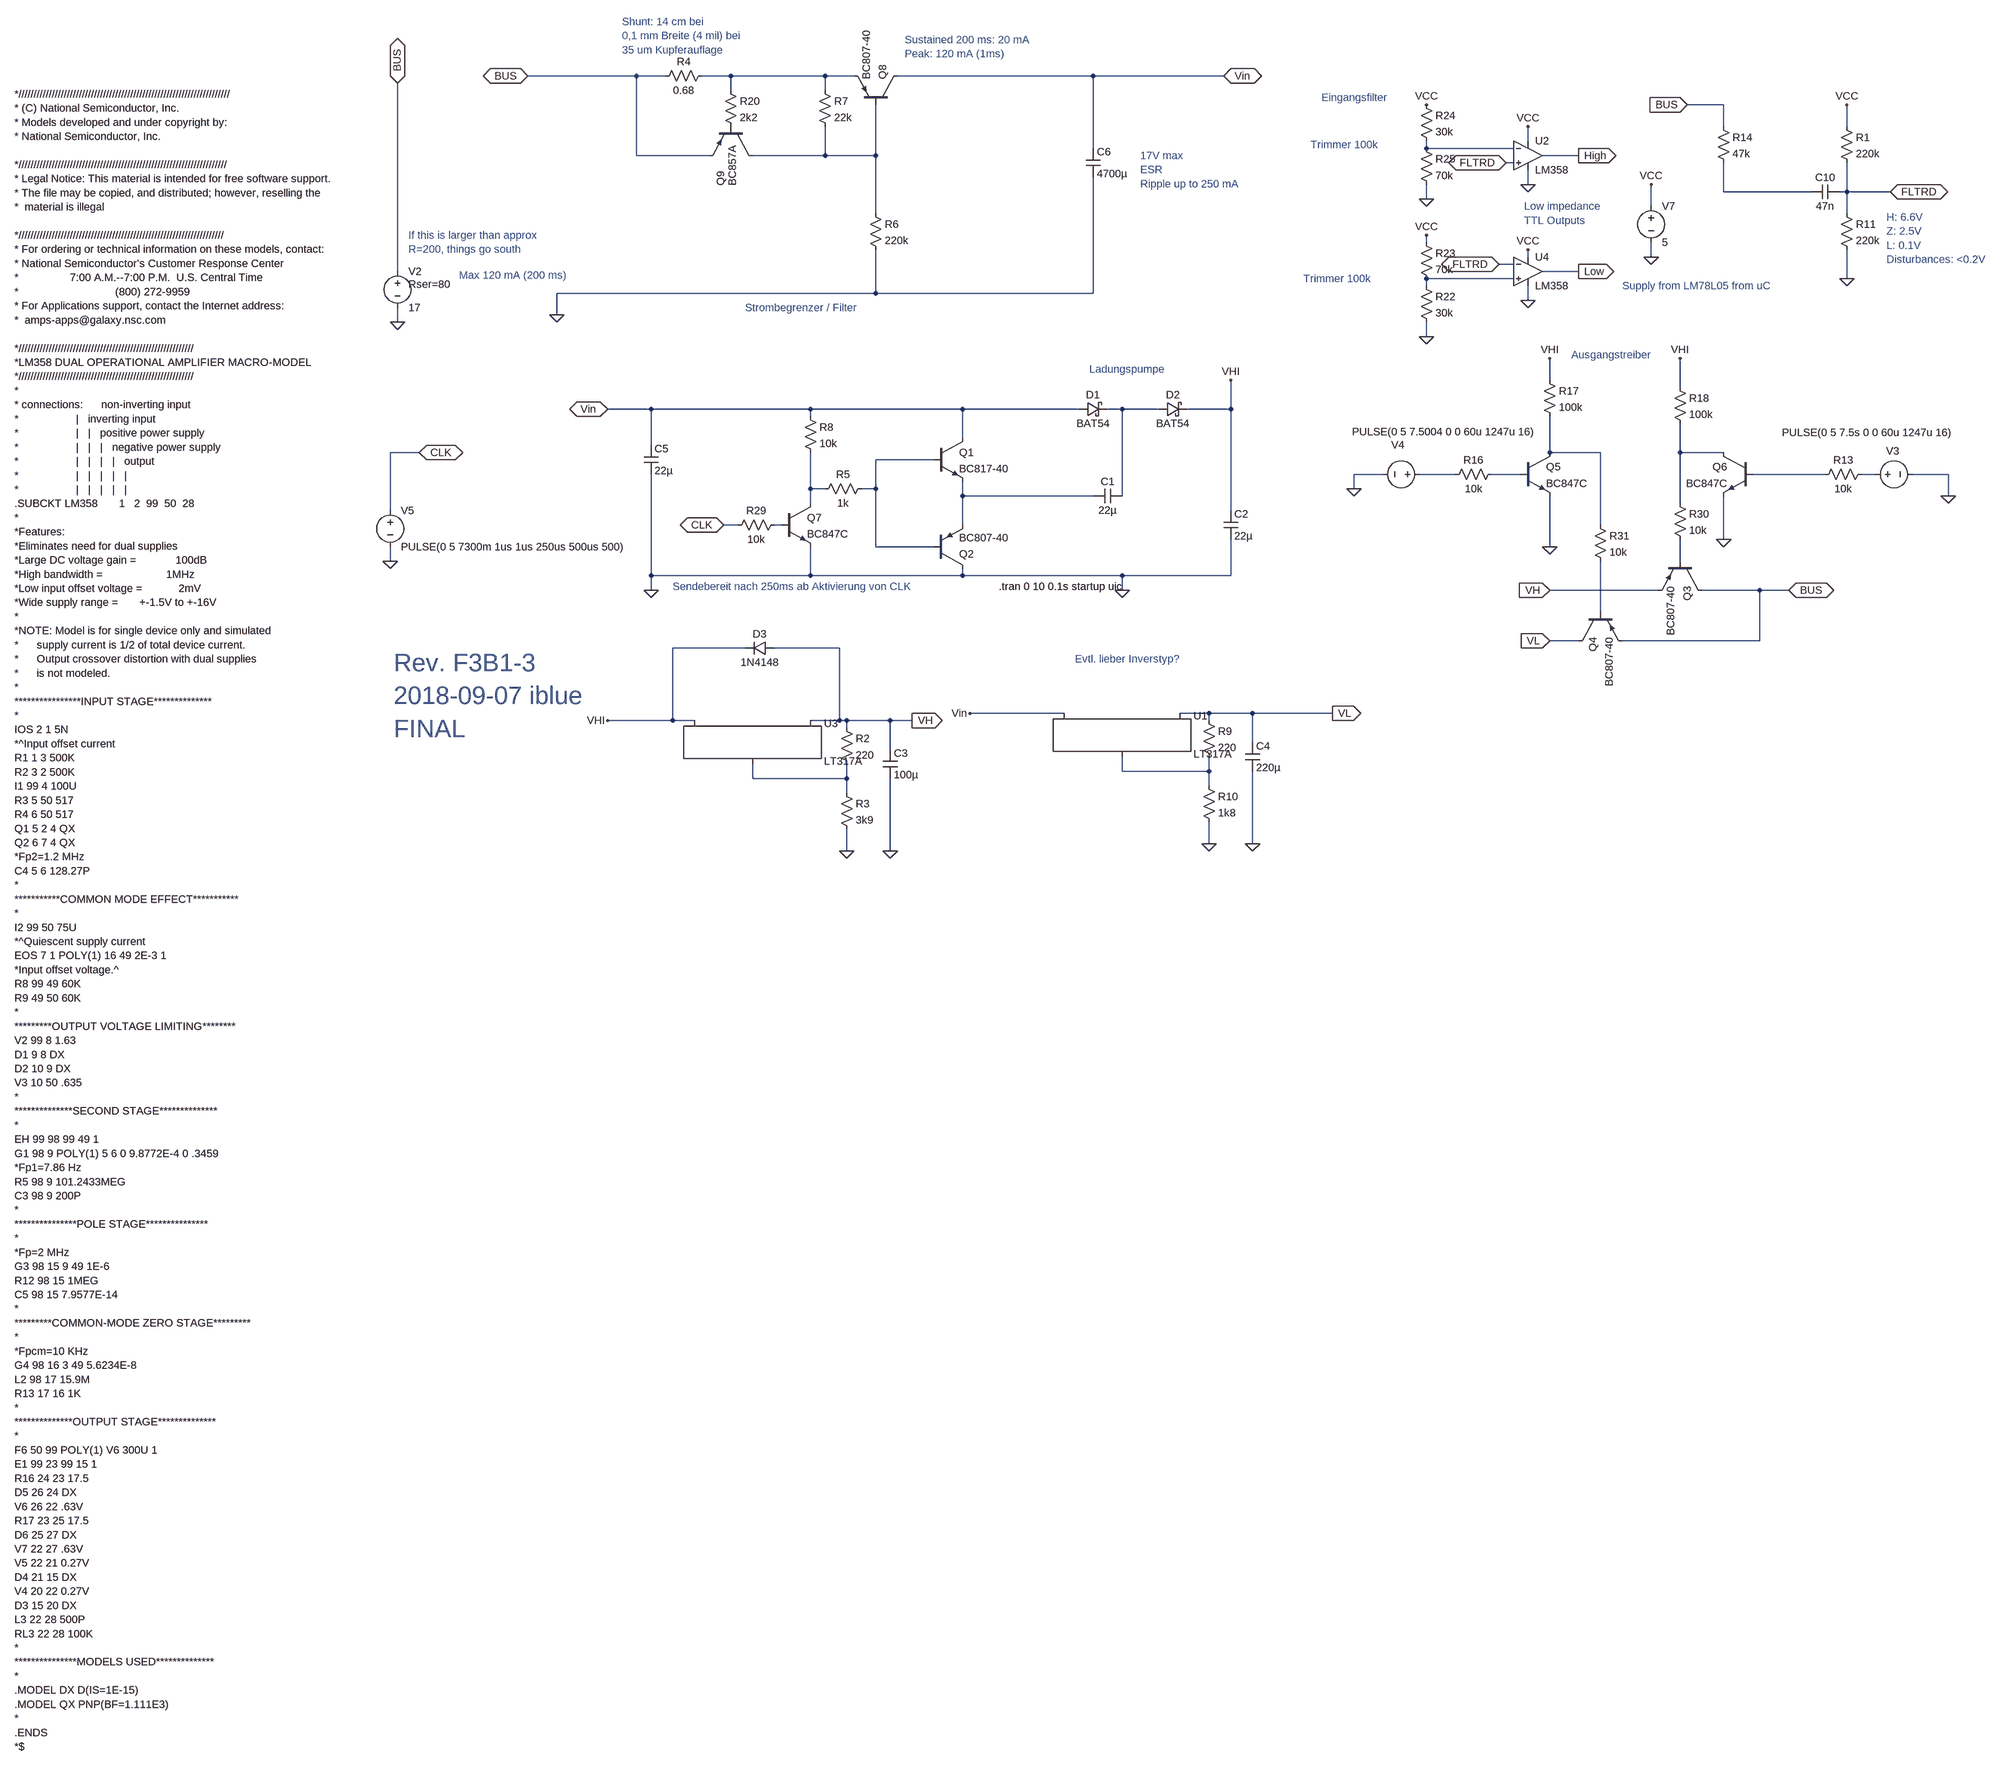
[diagram p0: schematic Final-F3B1-3.asc]
Final-F3B1-3.asc, the LTspice schematic file:
Version 4
SHEET 1 2516 2612
WIRE -1648 -800 -1888 -800
WIRE -1584 -800 -1648 -800
WIRE -1440 -800 -1504 -800
WIRE -1232 -800 -1440 -800
WIRE -1168 -800 -1232 -800
WIRE -640 -800 -1072 -800
WIRE -352 -800 -640 -800
WIRE -1440 -768 -1440 -800
WIRE -1232 -768 -1232 -800
WIRE 752 -736 672 -736
WIRE 752 -688 752 -736
WIRE 1024 -688 1024 -736
WIRE 320 -656 320 -688
WIRE -640 -640 -640 -800
WIRE 96 -640 96 -656
WIRE 288 -640 96 -640
WIRE -1648 -624 -1648 -800
WIRE -1488 -624 -1648 -624
WIRE -1232 -624 -1232 -688
WIRE -1232 -624 -1392 -624
WIRE -1120 -624 -1120 -736
WIRE -1120 -624 -1232 -624
WIRE 432 -624 352 -624
WIRE 288 -608 272 -608
WIRE 320 -560 320 -592
WIRE 752 -544 752 -608
WIRE 944 -544 752 -544
WIRE 1024 -544 1024 -608
WIRE 1024 -544 1008 -544
WIRE 1120 -544 1024 -544
WIRE 96 -528 96 -560
WIRE 592 -512 592 -560
WIRE -1120 -496 -1120 -624
WIRE 1024 -496 1024 -544
WIRE 96 -432 96 -448
WIRE 320 -400 320 -416
WIRE 592 -400 592 -432
WIRE 288 -384 256 -384
WIRE -2176 -368 -2176 -784
WIRE 432 -368 352 -368
WIRE 288 -352 96 -352
WIRE 1024 -352 1024 -416
WIRE 96 -336 96 -352
WIRE -1120 -320 -1120 -416
WIRE -1120 -320 -1824 -320
WIRE -640 -320 -640 -576
WIRE -640 -320 -1120 -320
WIRE 320 -304 320 -336
WIRE -1824 -272 -1824 -320
WIRE -2176 -256 -2176 -288
WIRE 96 -224 96 -256
WIRE 368 -128 368 -176
WIRE 656 -112 656 -176
WIRE -1616 -64 -1712 -64
WIRE -1264 -64 -1616 -64
WIRE -928 -64 -1264 -64
WIRE -672 -64 -928 -64
WIRE -576 -64 -608 -64
WIRE -496 -64 -576 -64
WIRE -336 -64 -336 -128
WIRE -336 -64 -432 -64
WIRE -1264 -48 -1264 -64
WIRE -928 0 -928 -64
WIRE -1616 16 -1616 -64
WIRE -2128 32 -2192 32
WIRE 368 32 368 -48
WIRE 480 32 368 32
WIRE 656 32 656 -32
WIRE 752 32 656 32
WIRE -992 48 -1120 48
WIRE 0 80 -64 80
WIRE 160 80 80 80
WIRE 304 80 240 80
WIRE 976 80 816 80
WIRE 1088 80 1056 80
WIRE 1248 80 1168 80
WIRE -1264 112 -1264 32
WIRE -1232 112 -1264 112
WIRE -1120 112 -1120 48
WIRE -1120 112 -1152 112
WIRE -64 112 -64 80
WIRE -928 128 -928 96
WIRE -640 128 -928 128
WIRE -576 128 -576 -64
WIRE 1248 128 1248 80
WIRE -1264 144 -1264 112
WIRE 656 144 656 32
WIRE -2192 160 -2192 32
WIRE -336 160 -336 -64
WIRE -1424 192 -1456 192
WIRE -1328 192 -1344 192
WIRE -928 192 -928 128
WIRE 480 192 480 32
WIRE 752 224 752 128
WIRE -1120 240 -1120 112
WIRE -992 240 -1120 240
WIRE 368 240 368 128
WIRE -2192 272 -2192 240
WIRE 656 272 656 224
WIRE -1616 304 -1616 80
WIRE -1264 304 -1264 240
WIRE -1264 304 -1616 304
WIRE -928 304 -928 288
WIRE -928 304 -1264 304
WIRE -576 304 -928 304
WIRE -336 304 -336 224
WIRE -336 304 -576 304
WIRE -1616 336 -1616 304
WIRE -576 336 -576 304
WIRE 608 336 368 336
WIRE 832 336 704 336
WIRE 896 336 832 336
WIRE 480 384 480 272
WIRE 432 448 368 448
WIRE 832 448 832 336
WIRE 832 448 528 448
WIRE -1408 464 -1568 464
WIRE -1200 464 -1344 464
WIRE -704 608 -912 608
WIRE -384 608 -448 608
WIRE -288 608 -384 608
WIRE -112 608 -288 608
WIRE -1568 624 -1568 464
WIRE -1568 624 -1712 624
WIRE -1520 624 -1568 624
WIRE -1200 624 -1200 464
WIRE -1200 624 -1264 624
WIRE -1184 624 -1200 624
WIRE -1088 624 -1184 624
WIRE -1040 624 -1088 624
WIRE -384 624 -384 608
WIRE -1184 640 -1184 624
WIRE -288 672 -288 608
WIRE -1088 688 -1088 624
WIRE -576 736 -576 704
WIRE -384 736 -384 704
WIRE -384 736 -576 736
WIRE -1392 752 -1392 720
WIRE -1184 752 -1184 720
WIRE -1184 752 -1392 752
WIRE -384 768 -384 736
WIRE -1184 784 -1184 752
WIRE -384 896 -384 848
WIRE -288 896 -288 736
WIRE -1184 912 -1184 864
WIRE -1088 912 -1088 752
FLAG -576 336 0
FLAG -1456 192 CLK
IOPIN -1456 192 BiDir
FLAG -336 -128 VHI
FLAG -1040 624 VH
IOPIN -1040 624 Out
FLAG -1712 624 VHI
FLAG -1088 912 0
FLAG -112 608 VL
IOPIN -112 608 Out
FLAG 1248 128 0
FLAG 368 448 VL
IOPIN 368 448 In
FLAG 368 336 VH
IOPIN 368 336 In
FLAG 368 -176 VHI
FLAG -64 112 0
FLAG 368 240 0
FLAG 656 -176 VHI
FLAG 752 224 0
FLAG -2192 272 0
FLAG -2128 32 CLK
IOPIN -2128 32 BiDir
FLAG -2176 -256 0
FLAG -2176 -784 BUS
IOPIN -2176 -784 BiDir
FLAG -1824 -272 0
FLAG -352 -800 Vin
IOPIN -352 -800 BiDir
FLAG -1712 -64 Vin
IOPIN -1712 -64 BiDir
FLAG -1616 336 0
FLAG -1888 -800 BUS
IOPIN -1888 -800 BiDir
FLAG 896 336 BUS
IOPIN 896 336 BiDir
FLAG 672 -736 BUS
IOPIN 672 -736 In
FLAG 432 -368 Low
IOPIN 432 -368 Out
FLAG 432 -624 High
IOPIN 432 -624 Out
FLAG 320 -560 0
FLAG 320 -304 0
FLAG 96 -528 0
FLAG 96 -224 0
FLAG 592 -400 0
FLAG 592 -560 VCC
FLAG 320 -688 VCC
FLAG 320 -416 VCC
FLAG 96 -736 VCC
FLAG 1120 -544 FLTRD
IOPIN 1120 -544 BiDir
FLAG 272 -608 FLTRD
IOPIN 272 -608 BiDir
FLAG 96 -448 VCC
FLAG 256 -384 FLTRD
IOPIN 256 -384 BiDir
FLAG -912 608 Vin
FLAG -1184 912 0
FLAG -288 896 0
FLAG -384 896 0
FLAG 1024 -352 0
FLAG 1024 -736 VCC
SYMBOL schottky -672 -48 R270
WINDOW 0 32 32 VTop 2
WINDOW 3 0 32 VBottom 2
SYMATTR InstName D1
SYMATTR Value BAT54
SYMATTR Description Diode
SYMATTR Type diode
SYMBOL schottky -496 -48 R270
WINDOW 0 32 32 VTop 2
WINDOW 3 0 32 VBottom 2
SYMATTR InstName D2
SYMATTR Value BAT54
SYMATTR Description Diode
SYMATTR Type diode
SYMBOL cap -576 112 R90
WINDOW 0 0 32 VBottom 2
WINDOW 3 32 32 VTop 2
SYMATTR InstName C1
SYMATTR Value 22µ
SYMBOL cap -352 160 R0
SYMATTR InstName C2
SYMATTR Value 22µ
SYMBOL voltage 1072 80 M90
WINDOW 0 -51 68 VLeft 2
WINDOW 3 -92 185 VLeft 2
WINDOW 123 0 0 Left 0
WINDOW 39 0 0 Left 0
SYMATTR InstName V3
SYMATTR Value PULSE(0 5 7.5s 0 0 60u 1247u 16)
SYMBOL res 1072 64 R90
WINDOW 0 0 56 VBottom 2
WINDOW 3 32 56 VTop 2
SYMATTR InstName R13
SYMATTR Value 10k
SYMBOL voltage 96 80 M270
WINDOW 0 65 78 VLeft 2
WINDOW 3 94 164 VLeft 2
WINDOW 123 0 0 Left 0
WINDOW 39 0 0 Left 0
SYMATTR InstName V4
SYMATTR Value PULSE(0 5 7.5004 0 0 60u 1247u 16)
SYMBOL npn 304 32 R0
SYMATTR InstName Q5
SYMATTR Value BC847C
SYMBOL res 256 64 R90
WINDOW 0 0 56 VBottom 2
WINDOW 3 32 56 VTop 2
SYMATTR InstName R16
SYMATTR Value 10k
SYMBOL res 352 -144 R0
SYMATTR InstName R17
SYMATTR Value 100k
SYMBOL npn 816 32 M0
SYMATTR InstName Q6
SYMATTR Value BC847C
SYMBOL res 640 -128 R0
SYMATTR InstName R18
SYMATTR Value 100k
SYMBOL npn -992 0 R0
SYMATTR InstName Q1
SYMATTR Value BC817-40
SYMBOL pnp -992 288 M180
SYMATTR InstName Q2
SYMATTR Value BC807-40
SYMBOL npn -1328 144 R0
SYMATTR InstName Q7
SYMATTR Value BC847C
SYMBOL res -1280 -64 R0
SYMATTR InstName R8
SYMATTR Value 10k
SYMBOL voltage -2192 144 R0
WINDOW 123 0 0 Left 0
WINDOW 39 0 0 Left 0
SYMATTR InstName V5
SYMATTR Value PULSE(0 5 7300m 1us 1us 250us 500us 500)
SYMBOL cap -1632 16 R0
SYMATTR InstName C5
SYMATTR Value 22µ
SYMBOL voltage -2176 -384 R0
WINDOW 123 0 0 Left 0
WINDOW 39 24 44 Left 2
SYMATTR SpiceLine Rser=80
SYMATTR InstName V2
SYMATTR Value 17
SYMBOL pnp -1072 -736 M270
SYMATTR InstName Q8
SYMATTR Value BC807-40
SYMBOL cap -656 -640 R0
SYMATTR InstName C6
SYMATTR Value 4700µ
SYMBOL pnp 704 272 R90
SYMATTR InstName Q3
SYMATTR Value BC807-40
SYMBOL pnp 432 384 M90
SYMATTR InstName Q4
SYMATTR Value BC807-40
SYMBOL voltage 592 -528 R0
WINDOW 123 0 0 Left 0
WINDOW 39 0 0 Left 0
SYMATTR InstName V7
SYMATTR Value 5
SYMBOL res 80 -352 R0
SYMATTR InstName R22
SYMATTR Value 30k
SYMBOL res 80 -448 R0
SYMATTR InstName R23
SYMATTR Value 70k
SYMBOL res 80 -752 R0
SYMATTR InstName R24
SYMATTR Value 30k
SYMBOL res 80 -656 R0
SYMATTR InstName R25
SYMATTR Value 70k
SYMBOL Opamps\\opamp2 320 -688 R0
SYMATTR InstName U2
SYMATTR Value LM358
SYMBOL Opamps\\opamp2 320 -432 R0
SYMATTR InstName U4
SYMATTR Value LM358
SYMBOL cap 1008 -560 R90
WINDOW 0 0 32 VBottom 2
WINDOW 3 32 32 VTop 2
SYMATTR InstName C10
SYMATTR Value 47n
SYMBOL res -1488 -816 R90
WINDOW 0 0 56 VBottom 2
WINDOW 3 32 56 VTop 2
SYMATTR InstName R4
SYMATTR Value 0.68
SYMBOL pnp -1392 -688 R90
WINDOW 0 99 70 Left 2
WINDOW 3 42 44 Left 2
SYMATTR InstName Q9
SYMATTR Value BC857A
SYMBOL res -1456 -784 R0
SYMATTR InstName R20
SYMATTR Value 2k2
SYMBOL res -1328 176 R90
WINDOW 0 0 56 VBottom 2
WINDOW 3 32 56 VTop 2
SYMATTR InstName R29
SYMATTR Value 10k
SYMBOL res 640 128 R0
SYMATTR InstName R30
SYMATTR Value 10k
SYMBOL res 464 176 R0
SYMATTR InstName R31
SYMATTR Value 10k
SYMBOL res -1200 624 R0
SYMATTR InstName R2
SYMATTR Value 220
SYMBOL res -1200 768 R0
SYMATTR InstName R3
SYMATTR Value 3k9
SYMBOL PowerProducts\\LT317A -576 608 R0
SYMATTR InstName U1
SYMBOL res -400 608 R0
SYMATTR InstName R9
SYMATTR Value 220
SYMBOL res -400 752 R0
SYMATTR InstName R10
SYMATTR Value 1k8
SYMBOL cap -1104 688 R0
SYMATTR InstName C3
SYMATTR Value 100µ
SYMBOL cap -304 672 R0
SYMATTR InstName C4
SYMATTR Value 220µ
SYMBOL diode -1344 448 R90
WINDOW 0 0 32 VBottom 2
WINDOW 3 32 32 VTop 2
SYMATTR InstName D3
SYMATTR Value 1N4148
SYMBOL res -1136 -512 R0
SYMATTR InstName R6
SYMATTR Value 220k
SYMBOL res 1008 -512 R0
SYMATTR InstName R11
SYMATTR Value 220k
SYMBOL res 1008 -704 R0
SYMATTR InstName R1
SYMATTR Value 220k
SYMBOL res 736 -704 R0
SYMATTR InstName R14
SYMATTR Value 47k
SYMBOL res -1136 96 R90
WINDOW 0 0 56 VBottom 2
WINDOW 3 32 56 VTop 2
SYMATTR InstName R5
SYMATTR Value 1k
SYMBOL res -1248 -784 R0
SYMATTR InstName R7
SYMATTR Value 22k
SYMBOL PowerProducts\\LT317A -1392 624 R0
SYMATTR InstName U3
TEXT -848 328 Left 2 !.tran 0 10 0.1s startup uic
TEXT -648 -152 Left 2 ;Ladungspumpe
TEXT -3640 -760 Left 2 !*//////////////////////////////////////////////////////////////////////\n* (C) National Semiconductor, Inc.\n* Models developed and under copyright by:\n* National Semiconductor, Inc.  \n \n*/////////////////////////////////////////////////////////////////////\n* Legal Notice: This material is intended for free software support.\n* The file may be copied, and distributed; however, reselling the \n*  material is illegal\n \n*////////////////////////////////////////////////////////////////////\n* For ordering or technical information on these models, contact:\n* National Semiconductor's Customer Response Center\n*                 7:00 A.M.--7:00 P.M.  U.S. Central Time\n*                                (800) 272-9959\n* For Applications support, contact the Internet address:\n*  amps-apps@galaxy.nsc.com\n \n*//////////////////////////////////////////////////////////\n*LM358 DUAL OPERATIONAL AMPLIFIER MACRO-MODEL\n*//////////////////////////////////////////////////////////\n*\n* connections:      non-inverting input\n*                   |   inverting input\n*                   |   |   positive power supply\n*                   |   |   |   negative power supply\n*                   |   |   |   |   output\n*                   |   |   |   |   |\n*                   |   |   |   |   |\n.SUBCKT LM358       1   2  99  50  28\n*\n*Features:\n*Eliminates need for dual supplies\n*Large DC voltage gain =             100dB\n*High bandwidth =                     1MHz\n*Low input offset voltage =            2mV\n*Wide supply range =       +-1.5V to +-16V\n*\n*NOTE: Model is for single device only and simulated\n*      supply current is 1/2 of total device current.\n*      Output crossover distortion with dual supplies\n*      is not modeled.\n*\n****************INPUT STAGE**************\n*\nIOS 2 1 5N\n*^Input offset current\nR1 1 3 500K\nR2 3 2 500K\nI1 99 4 100U\nR3 5 50 517\nR4 6 50 517\nQ1 5 2 4 QX\nQ2 6 7 4 QX\n*Fp2=1.2 MHz\nC4 5 6 128.27P\n*\n***********COMMON MODE EFFECT***********\n*\nI2 99 50 75U\n*^Quiescent supply current\nEOS 7 1 POLY(1) 16 49 2E-3 1\n*Input offset voltage.^\nR8 99 49 60K\nR9 49 50 60K\n*\n*********OUTPUT VOLTAGE LIMITING********\nV2 99 8 1.63\nD1 9 8 DX\nD2 10 9 DX\nV3 10 50 .635\n*\n**************SECOND STAGE**************\n*\nEH 99 98 99 49 1\nG1 98 9 POLY(1) 5 6 0 9.8772E-4 0 .3459\n*Fp1=7.86 Hz\nR5 98 9 101.2433MEG\nC3 98 9 200P\n*\n***************POLE STAGE***************\n*\n*Fp=2 MHz\nG3 98 15 9 49 1E-6\nR12 98 15 1MEG\nC5 98 15 7.9577E-14\n*\n*********COMMON-MODE ZERO STAGE*********\n*\n*Fpcm=10 KHz\nG4 98 16 3 49 5.6234E-8               \nL2 98 17 15.9M\nR13 17 16 1K\n*\n**************OUTPUT STAGE**************\n*\nF6 50 99 POLY(1) V6 300U 1\nE1 99 23 99 15 1\nR16 24 23 17.5\nD5 26 24 DX\nV6 26 22 .63V\nR17 23 25 17.5\nD6 25 27 DX\nV7 22 27 .63V\nV5 22 21 0.27V\nD4 21 15 DX\nV4 20 22 0.27V\nD3 15 20 DX\nL3 22 28 500P\nRL3 22 28 100K\n*\n***************MODELS USED**************\n*\n.MODEL DX D(IS=1E-15)\n.MODEL QX PNP(BF=1.111E3)\n*\n.ENDS\n*$
TEXT -1568 328 Left 2 ;Sendebereit nach 250ms ab Aktivierung von CLK
TEXT -2184 496 Left 5 ;Rev. F3B1-3\n2018-09-07 iblue\nFINAL
TEXT 416 -184 Left 2 ;Ausgangstreiber
TEXT -136 -752 Left 2 ;Eingangsfilter
TEXT -2152 -448 Left 2 ;If this is larger than approx\nR=200, things go south
TEXT -1408 -288 Left 2 ;Strombegrenzer / Filter
TEXT -1680 -920 Left 2 ;Shunt: 14 cm bei \n0,1 mm Breite (4 mil) bei \n35 um Kupferauflage
TEXT -680 488 Left 2 ;Evtl. lieber Inverstyp?
TEXT -1056 -880 Left 2 ;Sustained 200 ms: 20 mA\nPeak: 120 mA (1ms)
TEXT -536 -624 Left 2 ;17V max\nESR\nRipple up to 250 mA
TEXT -2040 -360 Left 2 ;Max 120 mA (200 ms)
TEXT 312 -512 Left 2 ;Low impedance\nTTL Outputs
TEXT -176 -352 Left 2 ;Trimmer 100k
TEXT -160 -648 Left 2 ;Trimmer 100k
TEXT 528 -336 Left 2 ;Supply from LM78L05 from uC
TEXT 1112 -488 Left 2 ;H: 6.6V\nZ: 2.5V\nL: 0.1V\nDisturbances: <0.2V

The netlist it stands for:
* Final-F3B1-3.asc
D1 Vin N006 BAT54
D2 N006 VHI BAT54
C1 N006 N015 22µ
C2 VHI 0 22µ
V3 N013 0 PULSE(0 5 7.5s 0 0 60u 1247u 16)
R13 N013 N012 10k
V4 N010 0 PULSE(0 5 7.5004 0 0 60u 1247u 16)
Q5 N007 N011 0 0 BC847C
R16 N011 N010 10k
R17 VHI N007 100k
Q6 N008 N012 0 0 BC847C
R18 VHI N008 100k
Q1 Vin N009 N015 0 BC817-40
Q2 0 N009 N015 0 BC807-40
Q7 N014 N016 0 0 BC847C
R8 Vin N014 10k
V5 CLK 0 PULSE(0 5 7300m 1us 1us 250us 500us 500)
C5 Vin 0 22µ
V2 BUS 0 17 Rser=80
Q8 Vin N003 N001 0 BC807-40
C6 Vin 0 4700µ
Q3 BUS N017 VH 0 BC807-40
Q4 VL N018 BUS 0 BC807-40
V7 VCC 0 5
R22 N005 0 30k
R23 VCC N005 70k
R24 VCC N002 30k
R25 N002 0 70k
XU2 FLTRD N002 VCC 0 High LM358  ; pins In+ In- V+ V- OUT
XU4 N005 FLTRD VCC 0 Low LM358  ; pins In+ In- V+ V- OUT
C10 FLTRD N004 47n
R4 N001 BUS 0.68
Q9 N003 P001 BUS 0 BC857A
R20 N001 P001 2k2
R29 N016 CLK 10k
R30 N008 N017 10k
R31 N007 N018 10k
R2 VH N020 220
R3 N020 0 3k9
XU1 N019 VL Vin LT317A
R9 VL N019 220
R10 N019 0 1k8
C3 VH 0 100µ
C4 VL 0 220µ
D3 VH VHI 1N4148
R6 N003 0 220k
R11 FLTRD 0 220k
R1 VCC FLTRD 220k
R14 BUS N004 47k
R5 N009 N014 1k
R7 N001 N003 22k
XU3 N020 VH VHI LT317A
.model D D
.lib standard.dio
.model NPN NPN
.model PNP PNP
.lib standard.bjt
.tran 0 10 0.1s startup uic
* Ladungspumpe
*//////////////////////////////////////////////////////////////////////
* (C) National Semiconductor, Inc.
* Models developed and under copyright by:
* National Semiconductor, Inc.
*/////////////////////////////////////////////////////////////////////
* Legal Notice: This material is intended for free software support.
* The file may be copied, and distributed; however, reselling the
*  material is illegal
*////////////////////////////////////////////////////////////////////
* For ordering or technical information on these models, contact:
* National Semiconductor's Customer Response Center
*                 7:00 A.M.--7:00 P.M.  U.S. Central Time
*                                (800) 272-9959
* For Applications support, contact the Internet address:
*  amps-apps@galaxy.nsc.com
*//////////////////////////////////////////////////////////
*LM358 DUAL OPERATIONAL AMPLIFIER MACRO-MODEL
*//////////////////////////////////////////////////////////
*
* connections:      non-inverting input
*                   |   inverting input
*                   |   |   positive power supply
*                   |   |   |   negative power supply
*                   |   |   |   |   output
*                   |   |   |   |   |
*                   |   |   |   |   |
.SUBCKT LM358       1   2  99  50  28
*
*Features:
*Eliminates need for dual supplies
*Large DC voltage gain =             100dB
*High bandwidth =                     1MHz
*Low input offset voltage =            2mV
*Wide supply range =       +-1.5V to +-16V
*
*NOTE: Model is for single device only and simulated
*      supply current is 1/2 of total device current.
*      Output crossover distortion with dual supplies
*      is not modeled.
*
****************INPUT STAGE**************
*
IOS 2 1 5N
*^Input offset current
R1 1 3 500K
R2 3 2 500K
I1 99 4 100U
R3 5 50 517
R4 6 50 517
Q1 5 2 4 QX
Q2 6 7 4 QX
*Fp2=1.2 MHz
C4 5 6 128.27P
*
***********COMMON MODE EFFECT***********
*
I2 99 50 75U
*^Quiescent supply current
EOS 7 1 POLY(1) 16 49 2E-3 1
*Input offset voltage.^
R8 99 49 60K
R9 49 50 60K
*
*********OUTPUT VOLTAGE LIMITING********
V2 99 8 1.63
D1 9 8 DX
D2 10 9 DX
V3 10 50 .635
*
**************SECOND STAGE**************
*
EH 99 98 99 49 1
G1 98 9 POLY(1) 5 6 0 9.8772E-4 0 .3459
*Fp1=7.86 Hz
R5 98 9 101.2433MEG
C3 98 9 200P
*
***************POLE STAGE***************
*
*Fp=2 MHz
G3 98 15 9 49 1E-6
R12 98 15 1MEG
C5 98 15 7.9577E-14
*
*********COMMON-MODE ZERO STAGE*********
*
*Fpcm=10 KHz
G4 98 16 3 49 5.6234E-8
L2 98 17 15.9M
R13 17 16 1K
*
**************OUTPUT STAGE**************
*
F6 50 99 POLY(1) V6 300U 1
E1 99 23 99 15 1
R16 24 23 17.5
D5 26 24 DX
V6 26 22 .63V
R17 23 25 17.5
D6 25 27 DX
V7 22 27 .63V
V5 22 21 0.27V
D4 21 15 DX
V4 20 22 0.27V
D3 15 20 DX
L3 22 28 500P
RL3 22 28 100K
*
***************MODELS USED**************
*
.MODEL DX D(IS=1E-15)
.MODEL QX PNP(BF=1.111E3)
*
.ENDS
*$
* Sendebereit nach 250ms ab Aktivierung von CLK
* Rev. F3B1-3
* 2018-09-07 iblue
* FINAL
* Ausgangstreiber
* Eingangsfilter
* If this is larger than approx
* R=200, things go south
* Strombegrenzer / Filter
* Shunt: 14 cm bei
* 0,1 mm Breite (4 mil) bei
* 35 um Kupferauflage
* Evtl. lieber Inverstyp?
* Sustained 200 ms: 20 mA
* Peak: 120 mA (1ms)
* 17V max
* ESR
* Ripple up to 250 mA
* Max 120 mA (200 ms)
* Low impedance
* TTL Outputs
* Trimmer 100k
* Trimmer 100k
* Supply from LM78L05 from uC
* H: 6.6V
* Z: 2.5V
* L: 0.1V
* Disturbances: <0.2V
.lib LTC.lib
.backanno
.end